# Altium schematic sheet RK3568-Audio-Interface.SchDoc
size 420 x 297 mm; SheetNumber: 13; SheetTotal: 25
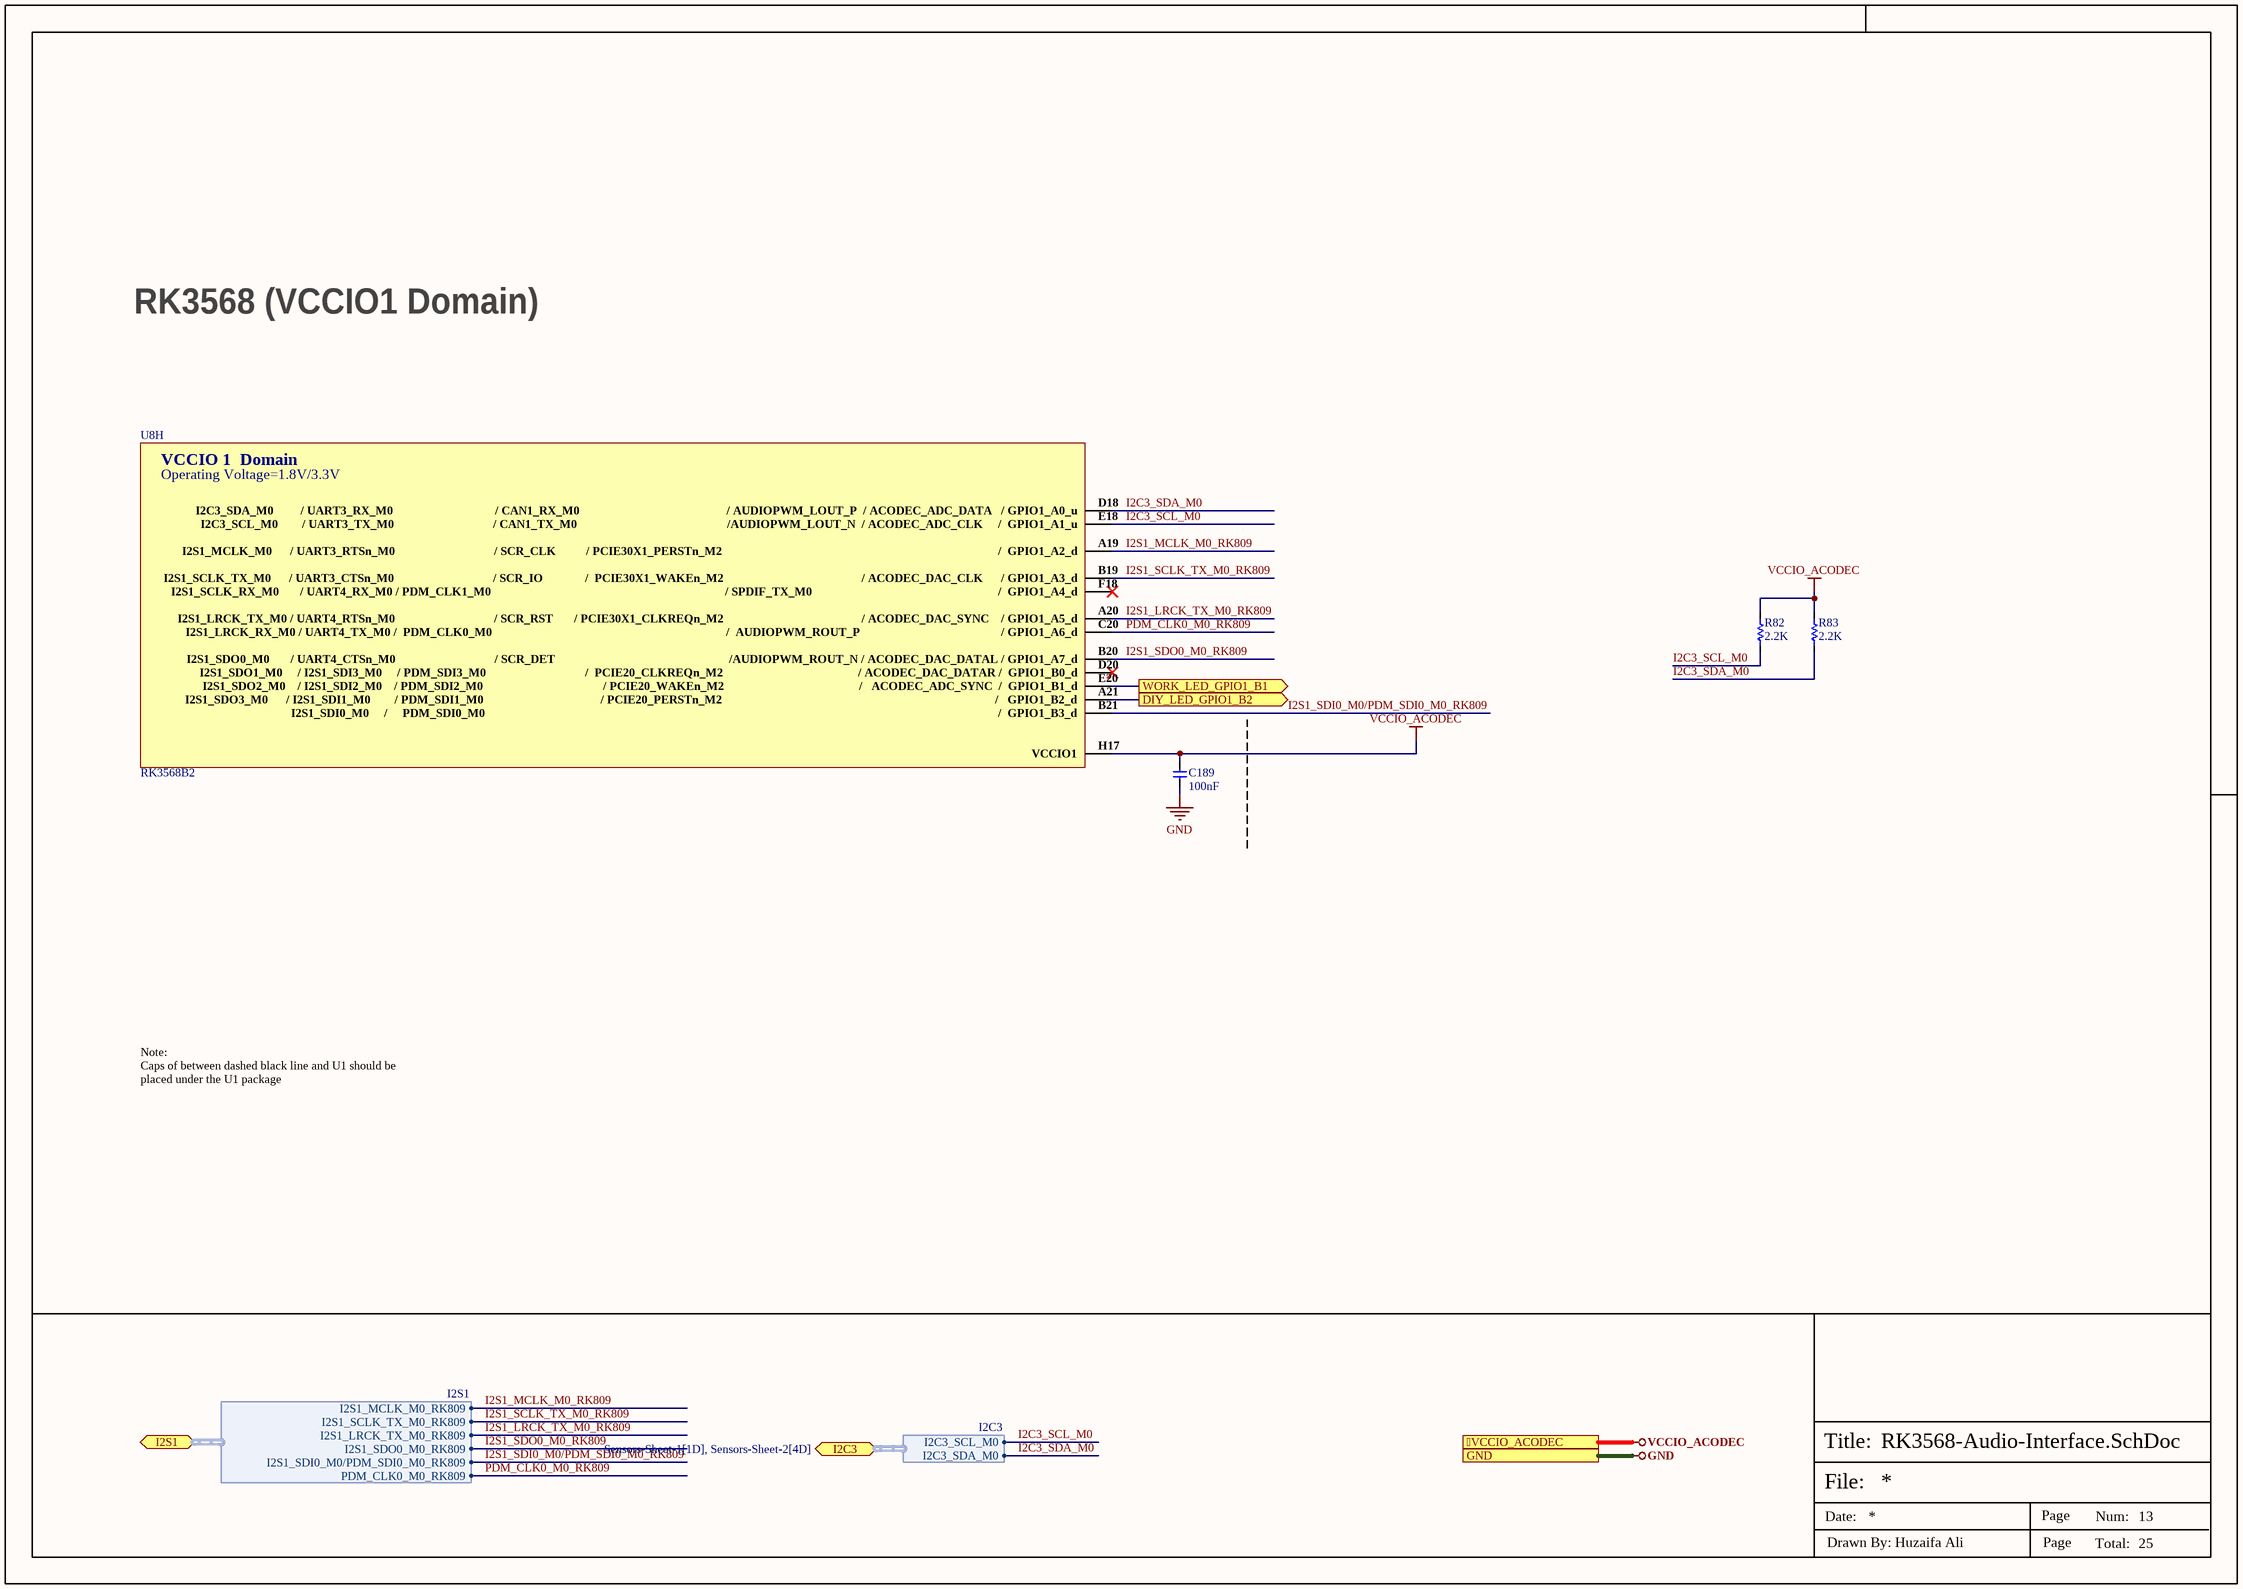
[diagram p0: RK3568-Audio-Interface.SchDoc]

## Parts
C189  100nF  [CAP-0201]
R82  2.2K  [Res-0402]
R83  2.2K  [Res-0402]
U8  RK3568B2  [FCCSP-636L]  (part H of 23)

## Ports
VCCIO_ACODEC, DIY_LED_GPIO1_B2 (out, see LED-Debug-Sheet[3C]), GND (see CAN-Bus-SPI-Flash-Sheet[4D], Connector-Sheet[5D], DRAM-LPDDR4x-Sheet[4D], eMMC-Sheet[4D], LED-Debug-Sheet[4D], Power-DC-IN-Sheet[4D], Power-Others-Sheet[4D], Power-PMIC-Sheet[4D], RK3568-Flash-SD-Controller[4D], RK3568-OSC-PMUIO-Sheet[5D], RK3568-Power-Sheet[4D], RK3568-SARADC-GPIO[4D], RK3568-USB-PCIe-Sheet[5D], RK3568-VI-Interface-Sheet[4D], RK3568-VO-Interface-1[4D], RK3568-VO-Interface-2[4D], Sensors-Sheet-1[4D], Sensors-Sheet-2[5D], Type-C-Sheet[4D], USB-Ports[4D], VO-HDMI2.0-TX-Sheet[4D], VO-LCM-MIPI-DSI-TX0[4D], WIFI-BT-SDIO-Sheet[4D]), I2C3 (bidir, harness I2C3, see Sensors-Sheet-1[1D], Sensors-Sheet-2[4D]), I2S1 (bidir, harness I2S1, see Power-PMIC-Sheet[1D]), WORK_LED_GPIO1_B1 (out, see LED-Debug-Sheet[1C])

## Harnesses
I2S1: I2S1_MCLK_M0_RK809, I2S1_SCLK_TX_M0_RK809, I2S1_LRCK_TX_M0_RK809, I2S1_SDO0_M0_RK809, I2S1_SDI0_M0/PDM_SDI0_M0_RK809, PDM_CLK0_M0_RK809
I2C3: I2C3_SCL_M0, I2C3_SDA_M0

## Nets
GND: C189.1 ; port GND
VCCIO_ACODEC: C189.2 R82.2 R83.2 U8.H17(VCCIO1) ; port VCCIO_ACODEC
DIY_LED_GPIO1_B2: U8.A21(I2S1_SDO3_M0______/_I2S1_SDI1_M0________/_PDM_SDI1_M0_______________________________________/_PCIE20_PERSTn_M2___________________________________________________________________________________________/___GPIO1_B2_d) ; port DIY_LED_GPIO1_B2
I2C3_SCL_M0: R82.1 U8.E18(I2C3_SCL_M0________/_UART3_TX_M0_________________________________/_CAN1_TX_M0__________________________________________________/AUDIOPWM_LOUT_N__/_ACODEC_ADC_CLK_____/__GPIO1_A1_u) ; port I2C3.I2C3_SCL_M0
I2C3_SDA_M0: R83.1 U8.D18(I2C3_SDA_M0_________/_UART3_RX_M0__________________________________/_CAN1_RX_M0_________________________________________________/_AUDIOPWM_LOUT_P__/_ACODEC_ADC_DATA___/_GPIO1_A0_u) ; port I2C3.I2C3_SDA_M0
I2S1_LRCK_TX_M0_RK809: U8.A20(I2S1_LRCK_TX_M0_/_UART4_RTSn_M0_________________________________/_SCR_RST_______/_PCIE30X1_CLKREQn_M2______________________________________________/_ACODEC_DAC_SYNC____/_GPIO1_A5_d) ; port I2S1.I2S1_LRCK_TX_M0_RK809
I2S1_MCLK_M0_RK809: U8.A19(I2S1_MCLK_M0______/_UART3_RTSn_M0_________________________________/_SCR_CLK__________/_PCIE30X1_PERSTn_M2____________________________________________________________________________________________/__GPIO1_A2_d) ; port I2S1.I2S1_MCLK_M0_RK809
I2S1_SCLK_TX_M0_RK809: U8.B19(I2S1_SCLK_TX_M0______/_UART3_CTSn_M0_________________________________/_SCR_IO______________/__PCIE30X1_WAKEn_M2______________________________________________/_ACODEC_DAC_CLK______/_GPIO1_A3_d) ; port I2S1.I2S1_SCLK_TX_M0_RK809
I2S1_SDI0_M0/PDM_SDI0_M0_RK809: U8.B21(I2S1_SDI0_M0_____/_____PDM_SDI0_M0___________________________________________________________________________________________________________________________________________________________________________/__GPIO1_B3_d) ; port I2S1.I2S1_SDI0_M0/PDM_SDI0_M0_RK809
I2S1_SDO0_M0_RK809: U8.B20(I2S1_SDO0_M0_______/_UART4_CTSn_M0_________________________________/_SCR_DET__________________________________________________________/AUDIOPWM_ROUT_N_/_ACODEC_DAC_DATAL_/_GPIO1_A7_d) ; port I2S1.I2S1_SDO0_M0_RK809
PDM_CLK0_M0_RK809: U8.C20(I2S1_LRCK_RX_M0_/_UART4_TX_M0_/__PDM_CLK0_M0______________________________________________________________________________/__AUDIOPWM_ROUT_P_______________________________________________/_GPIO1_A6_d) ; port I2S1.PDM_CLK0_M0_RK809
WORK_LED_GPIO1_B1: U8.E20(I2S1_SDO2_M0____/_I2S1_SDI2_M0____/_PDM_SDI2_M0________________________________________/_PCIE20_WAKEn_M2_____________________________________________/___ACODEC_ADC_SYNC__/__GPIO1_B1_d) ; port WORK_LED_GPIO1_B1

Not connected (* = marked no-connect by the designer): U8 D20(I2S1_SDO1_M0_____/_I2S1_SDI3_M0_____/_PDM_SDI3_M0_________________________________/__PCIE20_CLKREQn_M2_____________________________________________/_ACODEC_DAC_DATAR_/__GPIO1_B0_d)* F18(I2S1_SCLK_RX_M0_______/_UART4_RX_M0_/_PDM_CLK1_M0______________________________________________________________________________/_SPDIF_TX_M0______________________________________________________________/__GPIO1_A4_d)*

## Notes on the sheet
- RK3568 (VCCIO1 Domain)
- Note:
  Caps of between dashed black line and U1 should be placed under the U1 package
- File:
- Title:
- Date:
- Page
- Num:
- Total:
- Drawn By: Huzaifa Ali
- (in symbol RK3568B2, part H) VCCIO 1  Domain; Operating Voltage=1.8V/3.3V

## Library data of the parts
C189 = CC0201KRX5R6BB104: CAP CER 0.1UF 10V X5R 0201; Manufacturer: Yageo; Tolerance: 10%; Supplier 1: Mouser; Manufacturer Part Number: CC0201KRX5R6BB104; RoHS: Yes; Category: Ceramic Capacitors; Stock 1: 824403; Pricing 1: 1=0.10000, 10=0.02400, 50=0.02400, 100=0.01900, 1000=0.01100, 10000=0.00900 (USD); Mount: Surface Mount; Case/Package: 0201; Case Code (Imperial): 0201; Case Code (Metric): 0603; Weight: 6E-06oz; Min Operating Temperature: -55°C; Max Operating Temperature: 85°C; Capacitance: 100nF; Dielectric: X5R; Voltage Rating (DC): 10V; Packaging: Tape and Reel; Termination: SMD/SMT; Resistor Type: Ceramic; Voltage Rating: 10V; Series: CC; Construction: Flat; Length: 0.6mm; Width: 0.012inch; Height: 0.3mm; Thickness: 0.013inch; Depth: 0.3mm; Radiation Hardening: No; Lead Free: Lead Free; Halogen Free: Halogen Free; RoHS Compliant: Yes; ComponentLink1URL: https://datasheet.ciiva.com/11587/upy-gphc-x5r-4v-to-50v-12-11587190.pdf?src-supplier=Avnet; ComponentLink1Description: https://datasheet.ciiva.com/11587/upy-gphc-x5r-4v-to-50v-12-11587190.pdf?src-supplier=Avnet; Supplier Part Number 1: 603-CC201KRX5R6BB104; LCSC Part Number: C190183
R82 R83 = RC0402FR-072K2L: RES SMD 2.2K OHM 1% 1/16W 0402; Manufacturer: Yageo; Resistance: 2.2kR; Power Rating: 63mW; Voltage Rating: 50V; Temperature Coefficient: 100ppm/°C; Supplier 1: Digi-Key; Manufacturer Part Number: RC0402FR-072K2L; Stock 1: 966157; Pricing 1: 1=0.1, 10=0.016, 100=0.0066, 1000=0.00299, 2500=0.00259, 5000=0.00214 (USD); Case/Package: 0402; Case Code (Imperial): 0402; Case Code (Metric): 1005; Weight: 2.3E-05oz; Size Code: 0402; Min Operating Temperature: -55°C; Max Operating Temperature: 155°C; Resistor Type: Thick Film; Packaging: Tape and Reel; Tolerance: 1%; Termination: SMD/SMT; Features: Moisture Resistant; Series: RC; Max Power Dissipation: 63mW; Number of Terminations: 2; Resistance Tolerance: 1%; Construction: Rectangular; Technology: THICK FILM; Length: 1mm; Width: 0.5mm; Height: 0.35mm; Depth: 0.5mm; RoHS Compliant: Yes; REACH SVHC: Unknown; Military Standard: Not; Lead Free: Lead Free; ComponentLink1URL: http://www.farnell.com/datasheets/2167052.pdf?src-supplier=Element14; ComponentLink1Description: http://www.farnell.com/datasheets/2167052.pdf?src-supplier=Element14; ComponentLink2URL: http://www.yageo.com/documents/recent/PYu-RC_Group_51_RoHS_L_9.pdf?src-supplier=Mouser; ComponentLink2Description: http://www.yageo.com/documents/recent/PYu-RC_Group_51_RoHS_L_9.pdf?src-supplier=Mouser; ComponentLink3URL: http://documents.rs-components.com/techlib://itc_doclist_GB.htm?stockno=6186532&src-supplier=RSComponents; ComponentLink3Description: http://documents.rs-components.com/techlib://itc_doclist_GB.htm?stockno=6186532&src-supplier=RSComponents; ComponentLink4URL: http://www.yageo.com/documents/recent/PYu-RC0402_51_RoHS_L_6_r.pdf?src-supplier=Future+Electronics; ComponentLink4Description: http://www.yageo.com/documents/recent/PYu-RC0402_51_RoHS_L_6_r.pdf?src-supplier=Future+Electronics; Supplier Part Number 1: 311-2.20KLRCT-ND; LCSC Part Number: C114762
U8 = RK3568B2: FCCSP-636L Microcontroller Units (MCUs/MPUs/SOCs) ROHS; Manufacturer: Rockchip; Item Type: IC; Manufacturer Part Number: RK3568B2; Package: FCCSP-636L; LCSC Part Number: C3345225